# Altium project AD592.PrjPcb
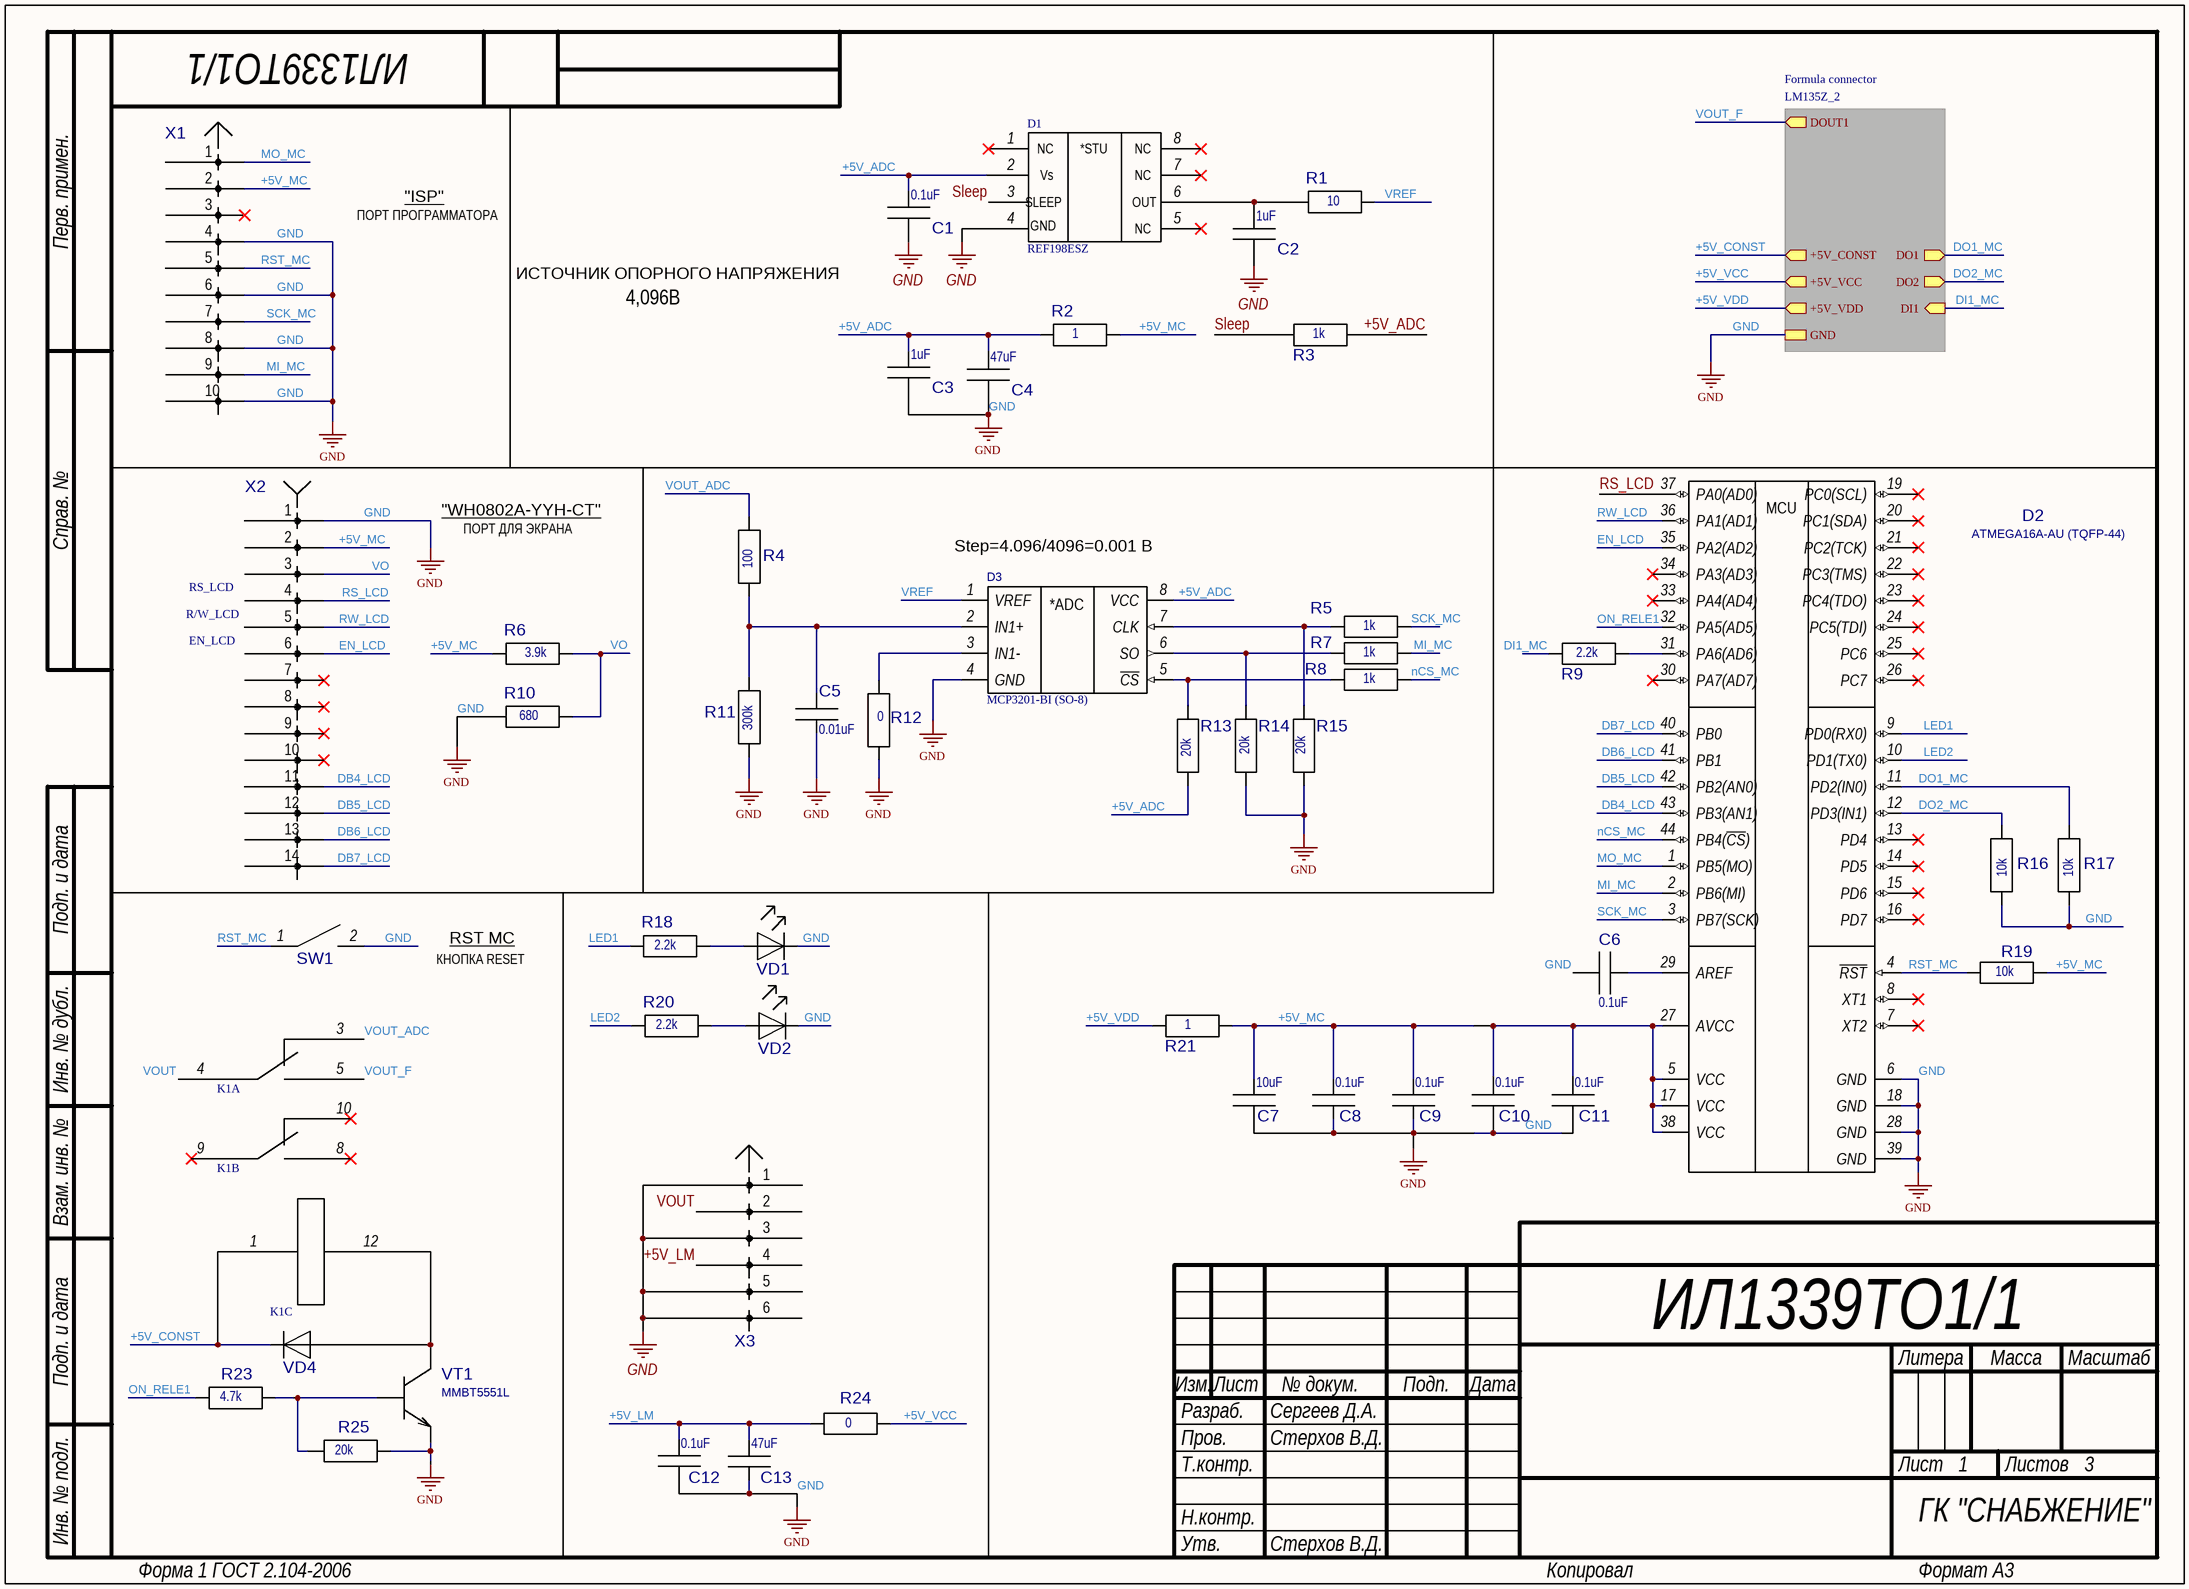
[diagram p0: AD592_1.SchDoc]
3 sheets, 66 parts. Net scope: hierarchical (ports join the sheet entries above them; power ports are global).
Board files: AD592.PcbDoc, AD592BNZ.PcbDoc
Sheets:
  AD592_1.SchDoc
  AD592_2.SchDoc
  AD592BNZ.SchDoc

## Sheet AD592_1.SchDoc: AD592BNZ
size 410 x 297 mm; ApprovedBy: Стерхов В.Д.; CheckedBy: Стерхов В.Д.; Author: Сергеев Д.А.; CompanyName: ГК "СНАБЖЕНИЕ"; DrawnBy: Сергеев Д.А.; Engineer: Сергеев Д.А.; Organization: ГК "СНАБЖЕНИЕ"; DocumentNumber: ИЛ1339ТО1/1; SheetNumber: 1; SheetTotal: 3

### Parts
(Parts that share a designator on the sheet are numbered #1, #2 ... from top to bottom, then left to right.)
C1#1  0.1uF  [0805]
C2#1  1uF  [0805]
C3#1  1uF  [0805]
C4  47uF  [0805]
C5  0.01uF  [0805]
C6  0.1uF  [0805]
C7  10uF  [0805]
C8  0.1uF  [0805]
C9  0.1uF  [0805]
C10  0.1uF  [0805]
C11  0.1uF  [0805]
C12  0.1uF  [0805]
C13  47uF  [0805]
D1#1  REF198ESZ  [SOIC-8(Microchip) - duplicate]
D2  ATMEGA16A-AU (TQFP-44)  [44-TQFP]
D3  MCP3201-BI (SO-8)  [SOIC-8(Microchip) - duplicate]
K1  V23079A1001B301 TE  [V23079A1001B301]  (value not drawn)  (parts A,B,C of 3)
R1#1  10  [0805]
R2#1  1  [0805]
R3#1  1k  [0805]
R4#1  100  [0805]
R5#1  1k  [0805]
R6  3.9k  [0805]
R7  1k  [0805]
R8  1k  [0805]
R9  2.2k  [0805]
R10  680  [0805]
R11  300k  [0805]
R12  0  [0805]
R13  20k  [0805]
R14  20k  [0805]
R15  20k  [0805]
R16  10k  [0805]
R17  10k  [0805]
R18  2.2k  [0805]
R19  10k  [0805]
R20  2.2k  [0805]
R21  1  [0805]
R23  4.7k  [0805]
R24  0  [0805]
R25  20k  [0805]
SW1  ВКН1  [BKN1]  (value not drawn)
VD1  LED(0805)  [0805(LED)]  (value not drawn)
VD2  LED(0805)  [0805(LED)]  (value not drawn)
VD4  LL4148 NXP  [SOD80C]  (value not drawn)
VT1  MMBT5551L  [SOT-23]
X1#1  PLD10-2,54  [PLD10-2,54]  (value not drawn)
X2#1  PLD14-2,54  [PLD14-2,54]  (value not drawn)
X3  PLD6-2,54  [PLD6-2,54]  (value not drawn)

### Sub-sheets
Formula connector = LM135Z_2 (file not in this document): DO1 (out), DO2 (out), DI1 (in), +5V_VCC (out), +5V_VDD (out), GND, +5V_CONST (out), DOUT1 (out)

### Nets
GND: C1#1.2 C2#1.2 C3#1.2 C4.2 C5.2 C6.2 C7.2 C8.2 C9.2 C10.2 C11.2 C12.2 C13.2 D1#1.4 D2.6(GND) D2.18(GND) D2.28(GND) D2.39(GND) D3.4(GND) R10.1 R11.2 R12.2 R14.2 R15.2 R16.1 R17.1 R25.2 SW1.2 VD1.2(K) VD2.2(K) VT1.2(E) X1#1.4 X1#1.6 X1#1.8 X1#1.10 X2#1.1 X3.1 X3.3 X3.5 X3.6 ; sheet Formula connector/GND
+5V_ADC: C1#1.1 C3#1.1 C4.1 D1#1.2 D3.8(VCC) R2#1.1 R3#1.2 R13.2
+5V_CONST: K1.1 VD4.2(K) ; sheet Formula connector/+5V_CONST
+5V_LM: C12.1 C13.1 R24.1 X3.4
+5V_MC: C7.1 C8.1 C9.1 C10.1 C11.1 D2.5(VCC) D2.17(VCC) D2.27(AVCC) D2.38(VCC) R2#1.2 R6.1 R19.1 R21.2 X1#1.2 X2#1.2
+5V_VCC: R24.2 ; sheet Formula connector/+5V_VCC
+5V_VDD: R21.1 ; sheet Formula connector/+5V_VDD
DB4_LCD: D2.43(PB3(AN1)) X2#1.11
DB5_LCD: D2.42(PB2(AN0)) X2#1.12
DB6_LCD: D2.41(PB1) X2#1.13
DB7_LCD: D2.40(PB0) X2#1.14
DI1_MC: R9.1 ; sheet Formula connector/DI1
DO1_MC: D2.11(PD2(IN0)) R17.2 ; sheet Formula connector/DO1
DO2_MC: D2.12(PD3(IN1)) R16.2 ; sheet Formula connector/DO2
EN_LCD: D2.35(PA2(AD2)) X2#1.6
LED1: D2.9(PD0(RX0)) R18.1
LED2: D2.10(PD1(TX0)) R20.1
MI_MC: D2.2(PB6(MI)) R7.1 X1#1.9
MO_MC: D2.1(PB5(MO)) X1#1.1
nCS_MC: D2.44(PB4(~{CS})) R8.1
ON_RELE1: D2.32(PA5(AD5)) R23.1
RS_LCD: D2.37(PA0(AD0)) X2#1.4
RST_MC: D2.4(~{RST}) R19.2 SW1.1 X1#1.5
RW_LCD: D2.36(PA1(AD1)) X2#1.5
SCK_MC: D2.3(PB7(SCK)) R5#1.1 X1#1.7
Sleep: D1#1.3 R3#1.1
VO: R6.2 R10.2 X2#1.3
VOUT: K1.4 X3.2
VOUT_ADC: K1.3 R4#1.1
VOUT_F: K1.5 ; sheet Formula connector/DOUT1
VREF: D3.1(VREF) R1#1.2
NetC2#1_1: C2#1.1 D1#1.6 R1#1.1
NetC5_1: C5.1 D3.2(IN1+) R4#1.2 R11.1
NetC6_1: C6.1 D2.29(AREF)
NetD2_31: D2.31(PA6(AD6)) R9.2
NetD3_3: D3.3(IN1-) R12.1
NetD3_5: D3.5(~{CS}) R8.2 R13.1
NetD3_6: D3.6(SO) R7.2 R14.1
NetD3_7: D3.7(CLK) R5#1.2 R15.1
NetK1_12: K1.12 VD4.1(A) VT1.3(K)
NetR18_2: R18.2 VD1.1(A)
NetR20_2: R20.2 VD2.1(A)
NetR23_2: R23.2 R25.1 VT1.1(B)

Not connected (* = marked no-connect by the designer): D1#1 1* 5* 7* 8*; D2 7(XT2)* 8(XT1)* 13(PD4)* 14(PD5)* 15(PD6)* 16(PD7)* 19(PC0(SCL))* 20(PC1(SDA))* 21(PC2(TCK))* 22(PC3(TMS))* 23(PC4(TDO))* 24(PC5(TDI))* 25(PC6)* 26(PC7)* 30(PA7(AD7))* 33(PA4(AD4))* 34(PA3(AD3))*; K1 8* 9* 10*; X1#1 3*; X2#1 7* 8* 9* 10*

### Notes on the sheet
- "ISP"
- ПОРТ ПРОГРАММАТОРА
- ИСТОЧНИК ОПОРНОГО НАПРЯЖЕНИЯ
- 4,096В
- "WH0802A-YYH-CT"
- ПОРТ ДЛЯ ЭКРАНА
- RS_LCD
- (near D3) Step=4.096/4096=0.001 В
- R/W_LCD
- EN_LCD
- RST MC
- КНОПКА RESET
- Перв. примен.
- Справ. №
- Подп. и дата
- Инв. № дубл.
- Взам. инв. №
- Разраб.
- Изм.
- Лист
- № докум.
- Подп.
- Дата
- Литера
- Масса
- Масштаб
- Пров.
- Т.контр.
- Листов
- Инв. № подл.
- Н.контр.
- Утв.
- Форма 1 ГОСТ 2.104-2006
- Копировал
- Формат А3
- (in symbol ATMEGA16A-AU (TQFP-44)) MCU
- (in symbol MCP3201-BI (SO-8)) *ADC
- (in symbol REF198ESZ) NC; *STU; Vs; SLEEP; OUT; GND

### Library data of the parts
C1#1 C2#1 C3#1 C4-C13 = C0805: ComponentHeigt: 1.3; Firme: AVX; Leadform: SMD; KIND: Конденсатор; ClassName: *; Component Link: *; ComponentWeigt: *; Packaging: 0805; NN: *
  C1#1 C6 C8-C12: Value: 0.1uF
  C2#1 C3#1: Value: 1uF
  C4 C13: Value: 47uF
  C5: Value: 0.01uF
  C7: Value: 10uF
D2 = ATMEGA16A-AU (TQFP-44): Leadform: по чертежу; Note: Установка по чертежу; Kind: Микросхема; Component Link: www.honeywell.com/radhard; ClassName: *; NN: *
D3 = MCP3201-BI (SO-8): ComponentHeigt: 1.8; Firme: Linear; Leadform: формована; Kind: Микросхема; ClassName: *; Component Link: *; Packaging: SOT-223; NN: *
R1#1 R2#1 R3#1 R4#1 R5#1 R6-R21 R23-R25 = R0805 Yageo: ComponentHeigt: 0.6; Firme: Yageo; Leadform: SMD; Kind: Резистор; ClassName: *; ComponentWeigt: *; Component Link: *; Packaging: 0805; NN: *
  R1#1: Value: 10
  R2#1 R21: Value: 1
  R3#1 R5#1 R7 R8: Value: 1k
  R4#1: Value: 100
  R6: Value: 3.9k
  R9 R18 R20: Value: 2.2k
  R10: Value: 680
  R11: Value: 300k
  R12 R24: Value: 0
  R13-R15 R25: Value: 20k
  R16 R17 R19: Value: 10k
  R23: Value: 4.7k
SW1 = ВКН1: Component Heigt: 5.2; Component Weigt: 1; Leadform: в отверстия по чертежу; NN: 25100618; KIND: Выключатель кнопочный ВКН-1 АСЖР.642130.003ТУ; ClassName: *; Component Link: *
VD1 VD2 = LED(0805): ComponentHeigt: 0.75; Leadform: в отверстия; Firme: Kingbright; NN: 24003000; KIND: Светодиод L-1154GD Kingbright; Component Link: *; ClassName: *
VD4 = LL4148 NXP: ComponentHeigt: 1.6; Leadform: SMD; NN: 24009301; KIND: Диод LL4148 NXP; Component Link: http://www.nxp.com; Packaging: SOD-80C; ClassName: *; Firme: NXP
VT1 = MMBT5551L: ComponentHeigt: 1.1; Firme: ONS; Leadform: SMD; NN: 24007468; KIND: Транзистор MMBT5551L*G ONS; ClassName: *; ComponentWeigt: *; Packaging: SOT-23
X1#1 = PLD10-2,54: ComponentHeigt: 5.5; Name: Вилка; Specification: Вилка PLD2-2 *; Typ: PLD2-2; ClassName: *; Component Link: *; ComponentWeigt: *; Firme: *; Leadform: *; NN: *; KIND: *
X2#1 = PLD14-2,54: ComponentHeigt: 5.5; Name: Вилка; Specification: Вилка PLD2-2 *; Typ: PLD2-2; ClassName: *; Component Link: *; ComponentWeigt: *; Firme: *; Leadform: *; NN: *; KIND: *
X3 = PLD6-2,54: ComponentHeigt: 5.5; Name: Вилка; Specification: Вилка PLD2-2 *; Typ: PLD2-2; ClassName: *; Component Link: *; ComponentWeigt: *; Firme: *; Leadform: *; NN: *; KIND: *

## Sheet AD592_2.SchDoc: AD592BNZ
size 410 x 297 mm; ApprovedBy: Стерхов В.Д.; CheckedBy: Стерхов В.Д.; Author: Сергеев Д.А.; CompanyName: ГК "СНАБЖЕНИЕ"; Engineer: Сергеев Д.А.; Organization: ГК "СНАБЖЕНИЕ"; DocumentNumber: ИЛ1339ТО1/1; SheetNumber: 2; SheetTotal: 3
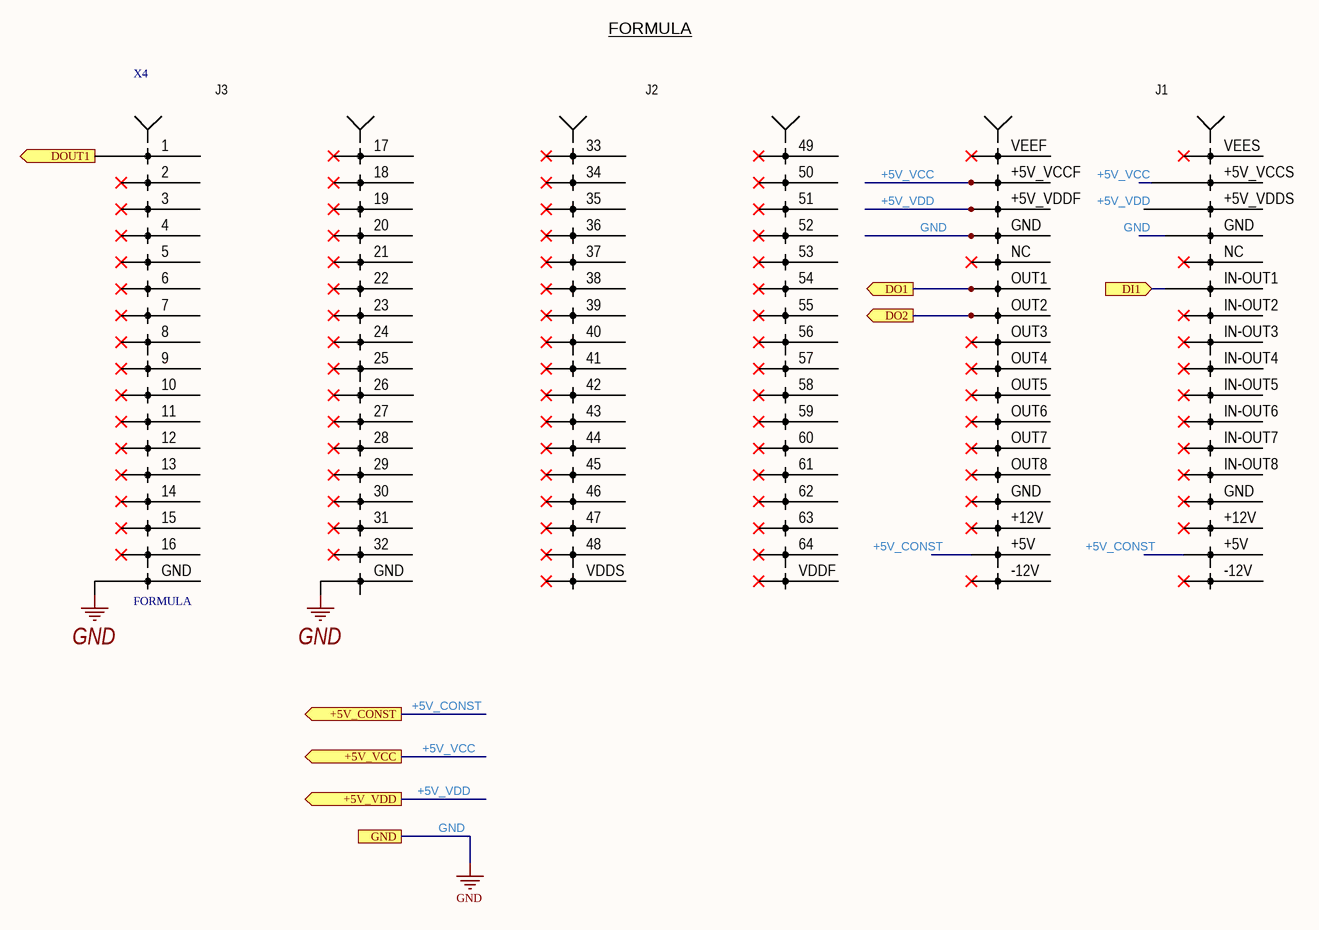
[diagram p1: AD592_2.SchDoc]

### Parts
X4  FORMULA  [FORMULA]

### Ports
+5V_CONST (out), +5V_VCC (out), +5V_VDD (out), DI1 (in), DO1 (out), DO2 (out), DOUT1 (out), GND

### Nets
GND: X4.GND ; port GND
+5V_CONST: X4.+5V ; port +5V_CONST
+5V_VCC: X4.+5V_VCCF(VCCF) X4.+5V_VCCS(VCCS) ; port +5V_VCC
+5V_VDD: X4.+5V_VDDF(VDDF) X4.+5V_VDDS(VDDS) ; port +5V_VDD
NetX4_1: X4.1 ; port DOUT1
NetX4_IN-OUT1: X4.IN-OUT1 ; port DI1
NetX4_OUT1: X4.OUT1 ; port DO1
NetX4_OUT2: X4.OUT2 ; port DO2

Not connected (* = marked no-connect by the designer): X4 2* 3* 4* 5* 6* 7* 8* 9* 10* 11* 12* 13* 14* 15* 16* 17* 18* 19* 20* 21* 22* 23* 24* 25* 26* 27* 28* 29* 30* 31* 32* 33* 34* 35* 36(4)* 37(5)* 38* 39* 40* 41* 42* 43* 44* 45* 46* 47* 48* 49* 50* 51* 52* 53* 54* 55* 56* 57* 58* 59* 60* 61* 62* 63* 64* +12V* -12V* IN-OUT2* IN-OUT3* IN-OUT4* IN-OUT5* IN-OUT6* IN-OUT7* IN-OUT8* NC* OUT3* OUT4* OUT5* OUT6* OUT7* OUT8* VDDF* VDDS* VEEF* VEES*

### Notes on the sheet
- FORMULA
- Перв. примен.
- Справ. №
- Подп. и дата
- Инв. № дубл.
- Взам. инв. №
- Разраб.
- Изм.
- Лист
- № докум.
- Подп.
- Дата
- Литера
- Масса
- Масштаб
- Пров.
- Т.контр.
- Листов
- Инв. № подл.
- Н.контр.
- Утв.
- Форма 1 ГОСТ 2.104-2006
- Копировал
- Формат А3
- (in symbol FORMULA) J3; J2; J1

## Sheet AD592BNZ.SchDoc: AD592BNZ
size 410 x 297 mm; ApprovedBy: Стерхов В.Д.; CheckedBy: Стерхов В.Д.; Author: Сергеев Д.А.; CompanyName: ГК "СНАБЖЕНИЕ"; DrawnBy: Сергеев Д.А.; Engineer: Сергеев Д.А.; Organization: ГК "СНАБЖЕНИЕ"; DocumentNumber: AD592BNZ; SheetNumber: 1; SheetTotal: 1
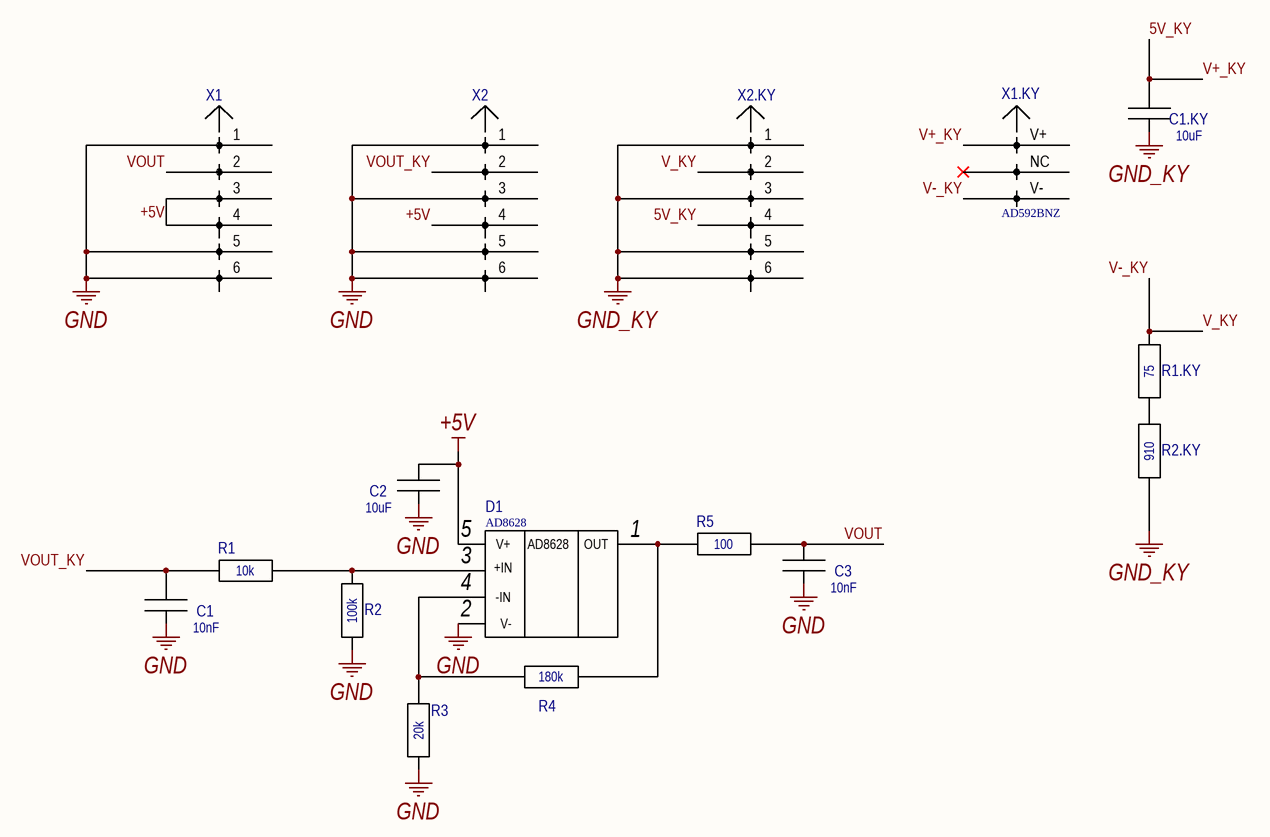
[diagram p2: AD592BNZ.SchDoc]

### Parts
(Parts that share a designator on the sheet are numbered #1, #2 ... from top to bottom, then left to right.)
C1#2  10nF  [0805]
C1.KY  10uF  [0805]
C2#2  10uF  [0805]
C3#2  10nF  [0805]
D1#2  AD8628  [SOT-23-5]
R1#2  10k  [0805]
R1.KY  75  [0805]
R2#2  100k  [0805]
R2.KY  910  [0805]
R3#2  20k  [0805]
R4#2  180k  [0805]
R5#2  100  [0805]
X1#2  PLD6-2,54  [PLD6-2,54]  (value not drawn)
X1.KY  AD592BNZ  [AD592]
X2#2  PLD6-2,54  [PLD6-2,54]  (value not drawn)
X2.KY  PLD6-2,54  [PLD6-2,54]  (value not drawn)

### Nets
+5V: C2#2.1 D1#2.5 X1#2.3 X1#2.4 X2#2.4
GND: C1#2.2 C2#2.2 C3#2.2 D1#2.2 R2#2.1 R3#2.2 X1#2.1 X1#2.5 X1#2.6 X2#2.1 X2#2.3 X2#2.5 X2#2.6
GND_KY: C1.KY.2 R2.KY.1 X2.KY.1 X2.KY.3 X2.KY.5 X2.KY.6
5V_KY: C1.KY.1 X1.KY.1 X2.KY.4  [also labelled V+_KY]
V-_KY: R1.KY.2 X1.KY.3 X2.KY.2  [also labelled V_KY]
VOUT: C3#2.1 R5#2.1 X1#2.2
VOUT_KY: C1#2.1 R1#2.2 X2#2.2
NetD1#2_1: D1#2.1 R4#2.1 R5#2.2
NetD1#2_3: D1#2.3 R1#2.1 R2#2.2
NetD1#2_4: D1#2.4 R3#2.1 R4#2.2
NetR1.KY_1: R1.KY.1 R2.KY.2

Not connected (* = marked no-connect by the designer): X1.KY 2*

### Notes on the sheet
- Перв. примен.
- Справ. №
- Подп. и дата
- Инв. № дубл.
- Взам. инв. №
- Разраб.
- Изм.
- Лист
- № докум.
- Подп.
- Дата
- Литера
- Масса
- Масштаб
- Пров.
- Т.контр.
- Листов
- Инв. № подл.
- Н.контр.
- Утв.
- Форма 1 ГОСТ 2.104-2006
- Копировал
- Формат А3
- (in symbol AD592BNZ) V+; NC; V-
- (in symbol AD8628) V+; OUT; +IN; -IN; V-

### Library data of the parts
C1#2 C1.KY C2#2 C3#2 = C0805: as C1#1 on sheet AD592_1; ClassName: *; Component Link: *; ComponentWeigt: *; Packaging: 0805; NN: *
  C1#2 C3#2: Value: 10nF
  C1.KY C2#2: Value: 10uF
R1#2 R1.KY R2#2 R2.KY R3#2 R4#2 R5#2 = R0805 Yageo: as R1#1 on sheet AD592_1; ClassName: *; ComponentWeigt: *; Component Link: *; Packaging: 0805; NN: *
  R1#2: Value: 10k
  R1.KY: Value: 75
  R2#2: Value: 100k
  R2.KY: Value: 910
  R3#2: Value: 20k
  R4#2: Value: 180k
  R5#2: Value: 100
X1#2 X2#2 X2.KY = PLD6-2,54: as X3 on sheet AD592_1; ClassName: *; Component Link: *; ComponentWeigt: *; Firme: *; Leadform: *; NN: *; KIND: *

## Nets that join several sheets
GND: AD592_1 (40 pins), AD592_2 (X4.GND), AD592BNZ (13 pins)